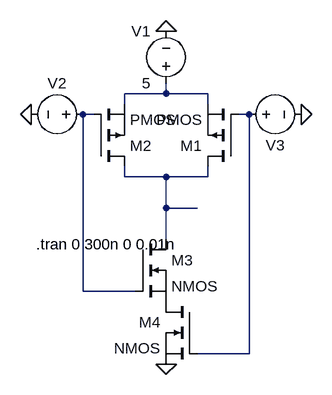
[diagram p0: schematic CMOS NAND.asc]
CMOS NAND.asc, the LTspice schematic file:
Version 4.1
SHEET 1 880 680
WIRE 208 80 208 64
WIRE 208 80 144 80
WIRE 272 80 208 80
WIRE 144 96 144 80
WIRE 272 96 272 80
WIRE 96 112 80 112
WIRE 336 112 320 112
WIRE 144 208 144 192
WIRE 208 208 144 208
WIRE 272 208 272 192
WIRE 272 208 208 208
WIRE 208 256 208 208
WIRE 256 256 208 256
WIRE 208 304 208 256
WIRE 80 384 80 112
WIRE 160 384 80 384
WIRE 336 480 336 112
WIRE 336 480 256 480
FLAG 208 -16 0
FLAG 0 112 0
FLAG 416 112 0
FLAG 208 496 0
SYMBOL voltage 208 80 R180
WINDOW 0 24 96 Left 2
WINDOW 3 24 16 Left 2
WINDOW 123 0 0 Left 0
WINDOW 39 0 0 Left 0
SYMATTR InstName V1
SYMATTR Value 5
SYMBOL voltage 96 112 R90
WINDOW 0 -32 56 VBottom 2
WINDOW 3 32 56 Invisible 2
WINDOW 123 0 0 Left 0
WINDOW 39 0 0 Left 0
SYMATTR InstName V2
SYMATTR Value PULSE(0 5 0n 1n 1n 50n 100n)
SYMBOL pmos 320 192 R180
SYMATTR InstName M1
SYMBOL voltage 320 112 R270
WINDOW 0 -32 56 VBottom 2
WINDOW 3 32 56 Invisible 2
WINDOW 123 0 0 Left 0
WINDOW 39 0 0 Left 0
SYMATTR InstName V3
SYMATTR Value PULSE(0 5 0n 1n 1n 25n 50n)
SYMBOL pmos 96 192 M180
SYMATTR InstName M2
SYMBOL nmos 160 304 R0
SYMATTR InstName M3
SYMBOL nmos 256 400 M0
SYMATTR InstName M4
TEXT 8 312 Left 2 !.tran 0 300n 0 0.01n

The netlist it stands for:
* CMOS NAND.asc
V1 N001 0 5
V2 N002 0 PULSE(0 5 0n 1n 1n 50n 100n)
M1 N004 N003 N001 N001 PMOS
V3 N003 0 PULSE(0 5 0n 1n 1n 25n 50n)
M2 N004 N002 N001 N001 PMOS
M3 N004 N002 P001 P001 NMOS
M4 P001 N003 0 0 NMOS
.model NMOS NMOS
.model PMOS PMOS
.lib standard.mos
.tran 0 300n 0 0.01n
.backanno
.end